# EAGLE schematic Esquema mat final (EAGLE 9.7.0)
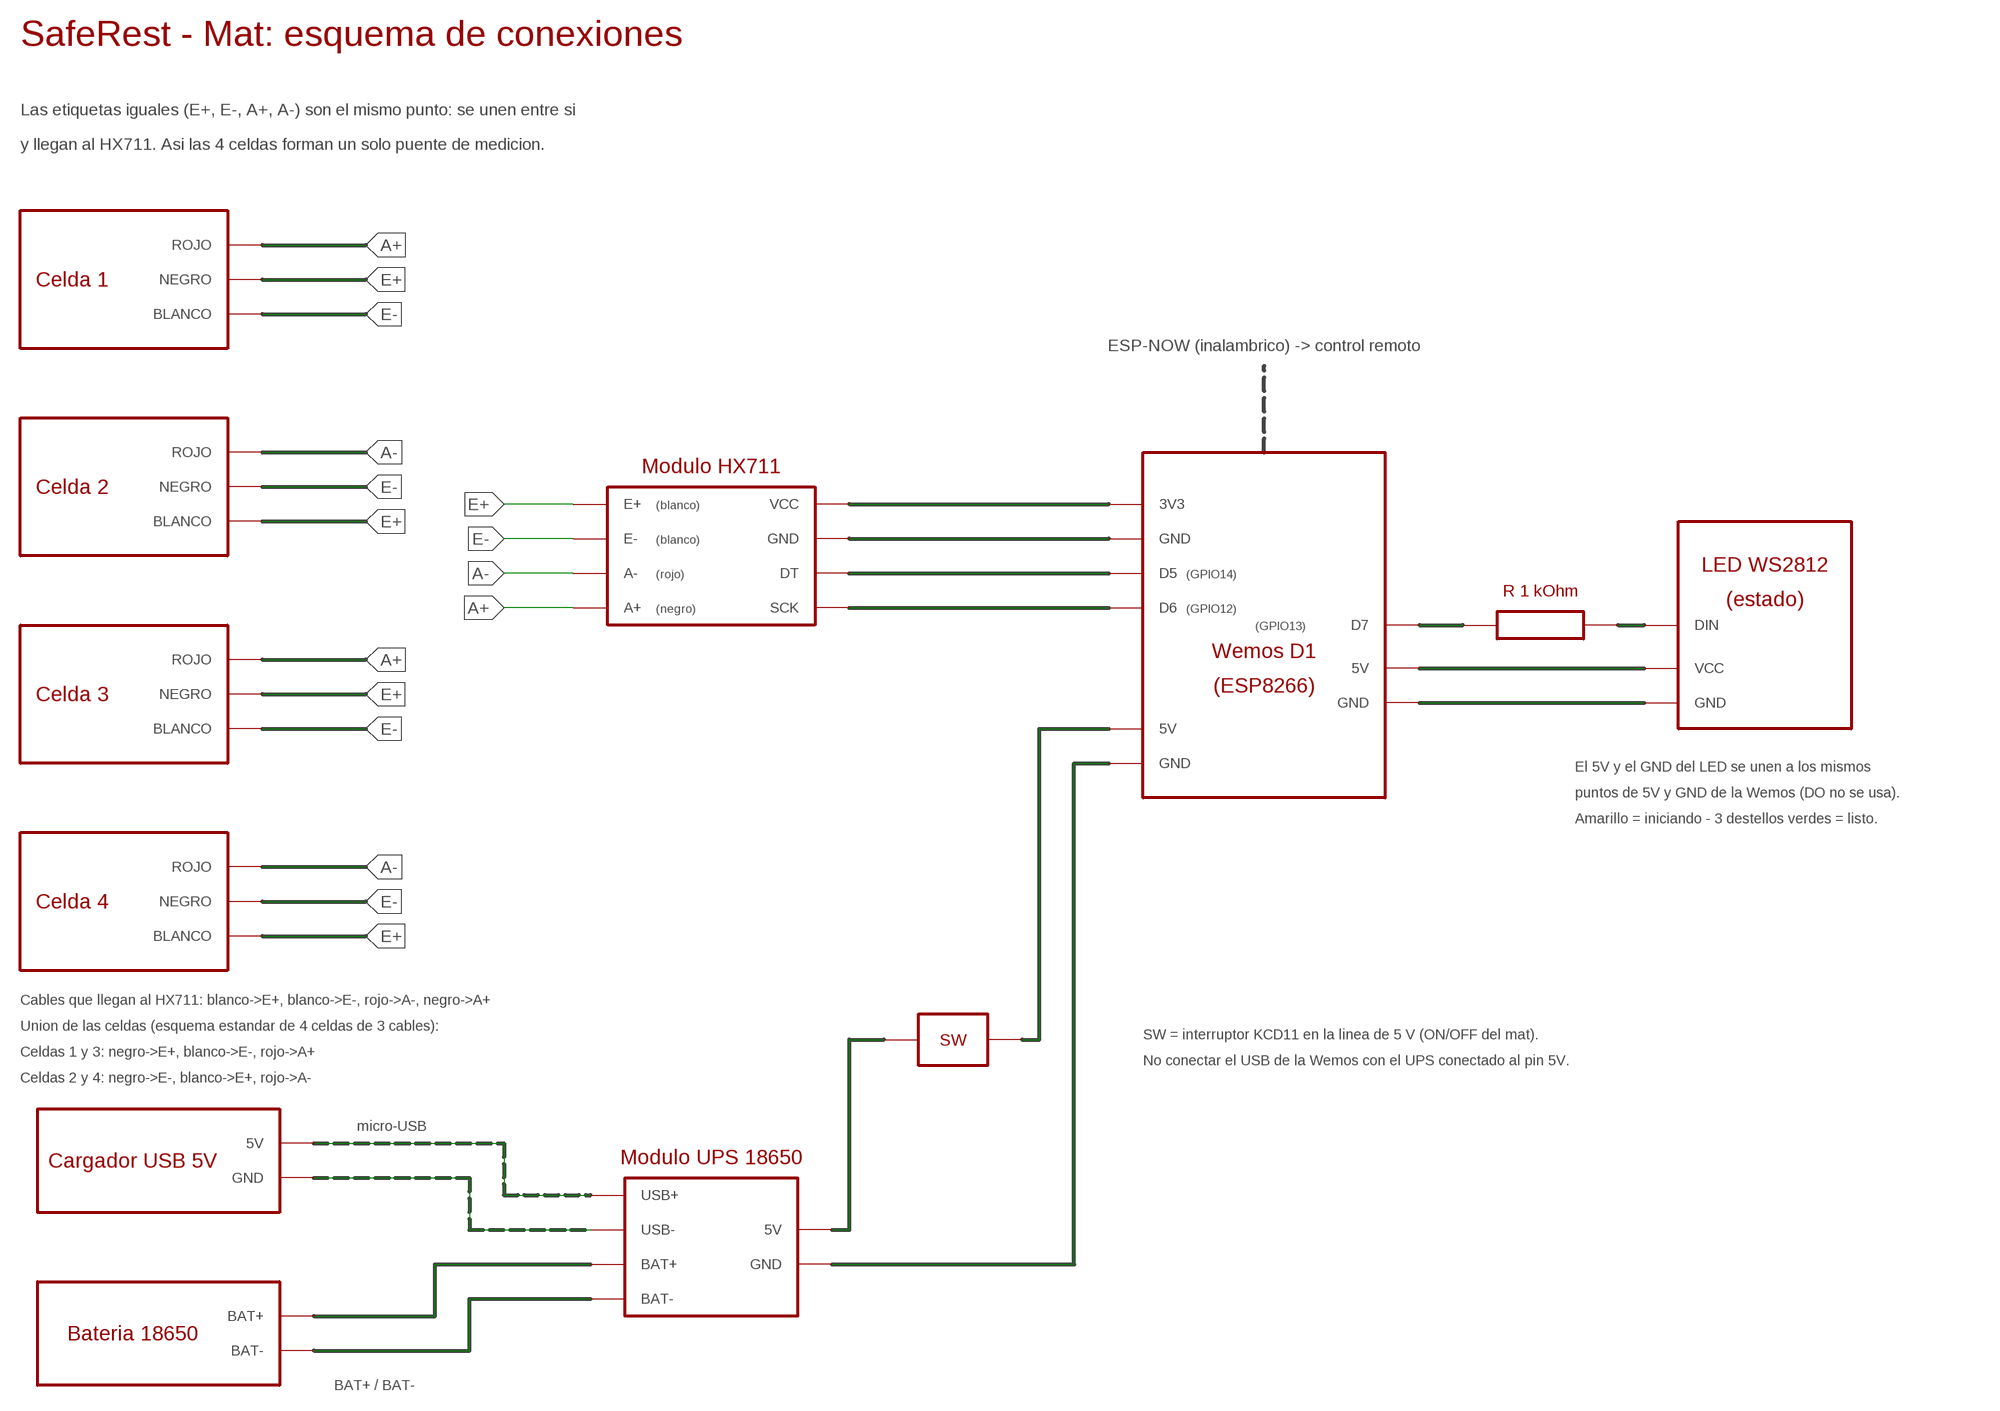
[diagram p0: schematic, sheet 1]

## Parts
BAT1  Bateria 18650  BATERIA_18650  [BATERIA_18650]
CELDA1  Celda 1  CELDA_CARGA  [CELDA_CARGA]
CELDA2  Celda 2  CELDA_CARGA  [CELDA_CARGA]
CELDA3  Celda 3  CELDA_CARGA  [CELDA_CARGA]
CELDA4  Celda 4  CELDA_CARGA  [CELDA_CARGA]
CHG1  Cargador USB 5V  CARGADOR_USB  [CARGADOR_USB]
LED1  WS2812  LED_WS2812  [LED_WS2812]
MCU1  Wemos D1 (ESP8266)  WEMOS_D1  [WEMOS_D1]
R1  1k  RESISTENCIA  [RESISTENCIA]
SW1  KCD11  INTERRUPTOR  [INTERRUPTOR]
U1  Modulo HX711  HX711  [HX711]
UPS1  Modulo UPS 18650  MODULO_UPS  [MODULO_UPS]

## Nets
3V3: MCU1.1(3V3) U1.5(VCC)
5V: LED1.2(VCC) MCU1.5(5V) MCU1.8(5V) SW1.2
5V_UPS: SW1.1 UPS1.5(5V)
A+: CELDA1.1(ROJO) CELDA3.1(ROJO) U1.4(A+)
A-: CELDA2.1(ROJO) CELDA4.1(ROJO) U1.3(A-)
BAT+: BAT1.1(BAT+) UPS1.3(BAT+)
BAT-: BAT1.2(BAT-) UPS1.4(BAT-)
D7: MCU1.7(D7) R1.1
DT: MCU1.3(D5) U1.7(DT)
E+: CELDA1.2(NEGRO) CELDA2.3(BLANCO) CELDA3.2(NEGRO) CELDA4.3(BLANCO) U1.1(E+)
E-: CELDA1.3(BLANCO) CELDA2.2(NEGRO) CELDA3.3(BLANCO) CELDA4.2(NEGRO) U1.2(E-)
GND: LED1.3(GND) MCU1.2(GND) MCU1.6(GND) MCU1.9(GND) U1.6(GND) UPS1.6(GND)
LED_DIN: LED1.1(DIN) R1.2
SCK: MCU1.4(D6) U1.8(SCK)
USB5V: CHG1.1(5V) UPS1.1(USB+)
USBGND: CHG1.2(GND) UPS1.2(USB-)

## Notes on the sheet
- SafeRest - Mat: esquema de conexiones
- Las etiquetas iguales (E+, E-, A+, A-) son el mismo punto: se unen entre si
- y llegan al HX711. Asi las 4 celdas forman un solo puente de medicion.
- Celda 1
- ESP-NOW (inalambrico) -> control remoto
- Modulo HX711
- Celda 2
- (blanco)
- (blanco)
- LED WS2812
- (rojo) | (GPIO14)
- R 1 kOhm
- (estado)
- (negro) | (GPIO12)
- (GPIO13)
- Wemos D1
- (ESP8266)
- Celda 3
- El 5V y el GND del LED se unen a los mismos
- puntos de 5V y GND de la Wemos (DO no se usa).
- Amarillo = iniciando - 3 destellos verdes = listo.
- Celda 4
- Cables que llegan al HX711: blanco->E+, blanco->E-, rojo->A-, negro->A+
- Union de las celdas (esquema estandar de 4 celdas de 3 cables):
- SW | SW = interruptor KCD11 en la linea de 5 V (ON/OFF del mat).
- Celdas 1 y 3: negro->E+, blanco->E-, rojo->A+
- No conectar el USB de la Wemos con el UPS conectado al pin 5V.
- Celdas 2 y 4: negro->E-, blanco->E+, rojo->A-
- micro-USB
- Cargador USB 5V | Modulo UPS 18650
- Bateria 18650
- BAT+ / BAT-

## Library data of the parts
BAT1 = SafeRest:BATERIA_18650
CELDA1-CELDA4 = SafeRest:CELDA_CARGA
CHG1 = SafeRest:CARGADOR_USB
LED1 = SafeRest:LED_WS2812
MCU1 = SafeRest:WEMOS_D1
R1 = SafeRest:RESISTENCIA
SW1 = SafeRest:INTERRUPTOR
U1 = SafeRest:HX711
UPS1 = SafeRest:MODULO_UPS